# EasyEDA Pro project ProProject_2023新生开发板（小组）_2025-05-30.epro, schematic Schematic1_3
Create Date: 2024-03-11; Page Name: P1; Project Name: 2023新生开发板; Schematic Name: Schematic1_3; Update Date: 2024-03-11; Company: 学生电子爱好者协会; Drawed: ZhengLi; Page Size: A3; Reviewed: ZhengLi; Version: V2.2
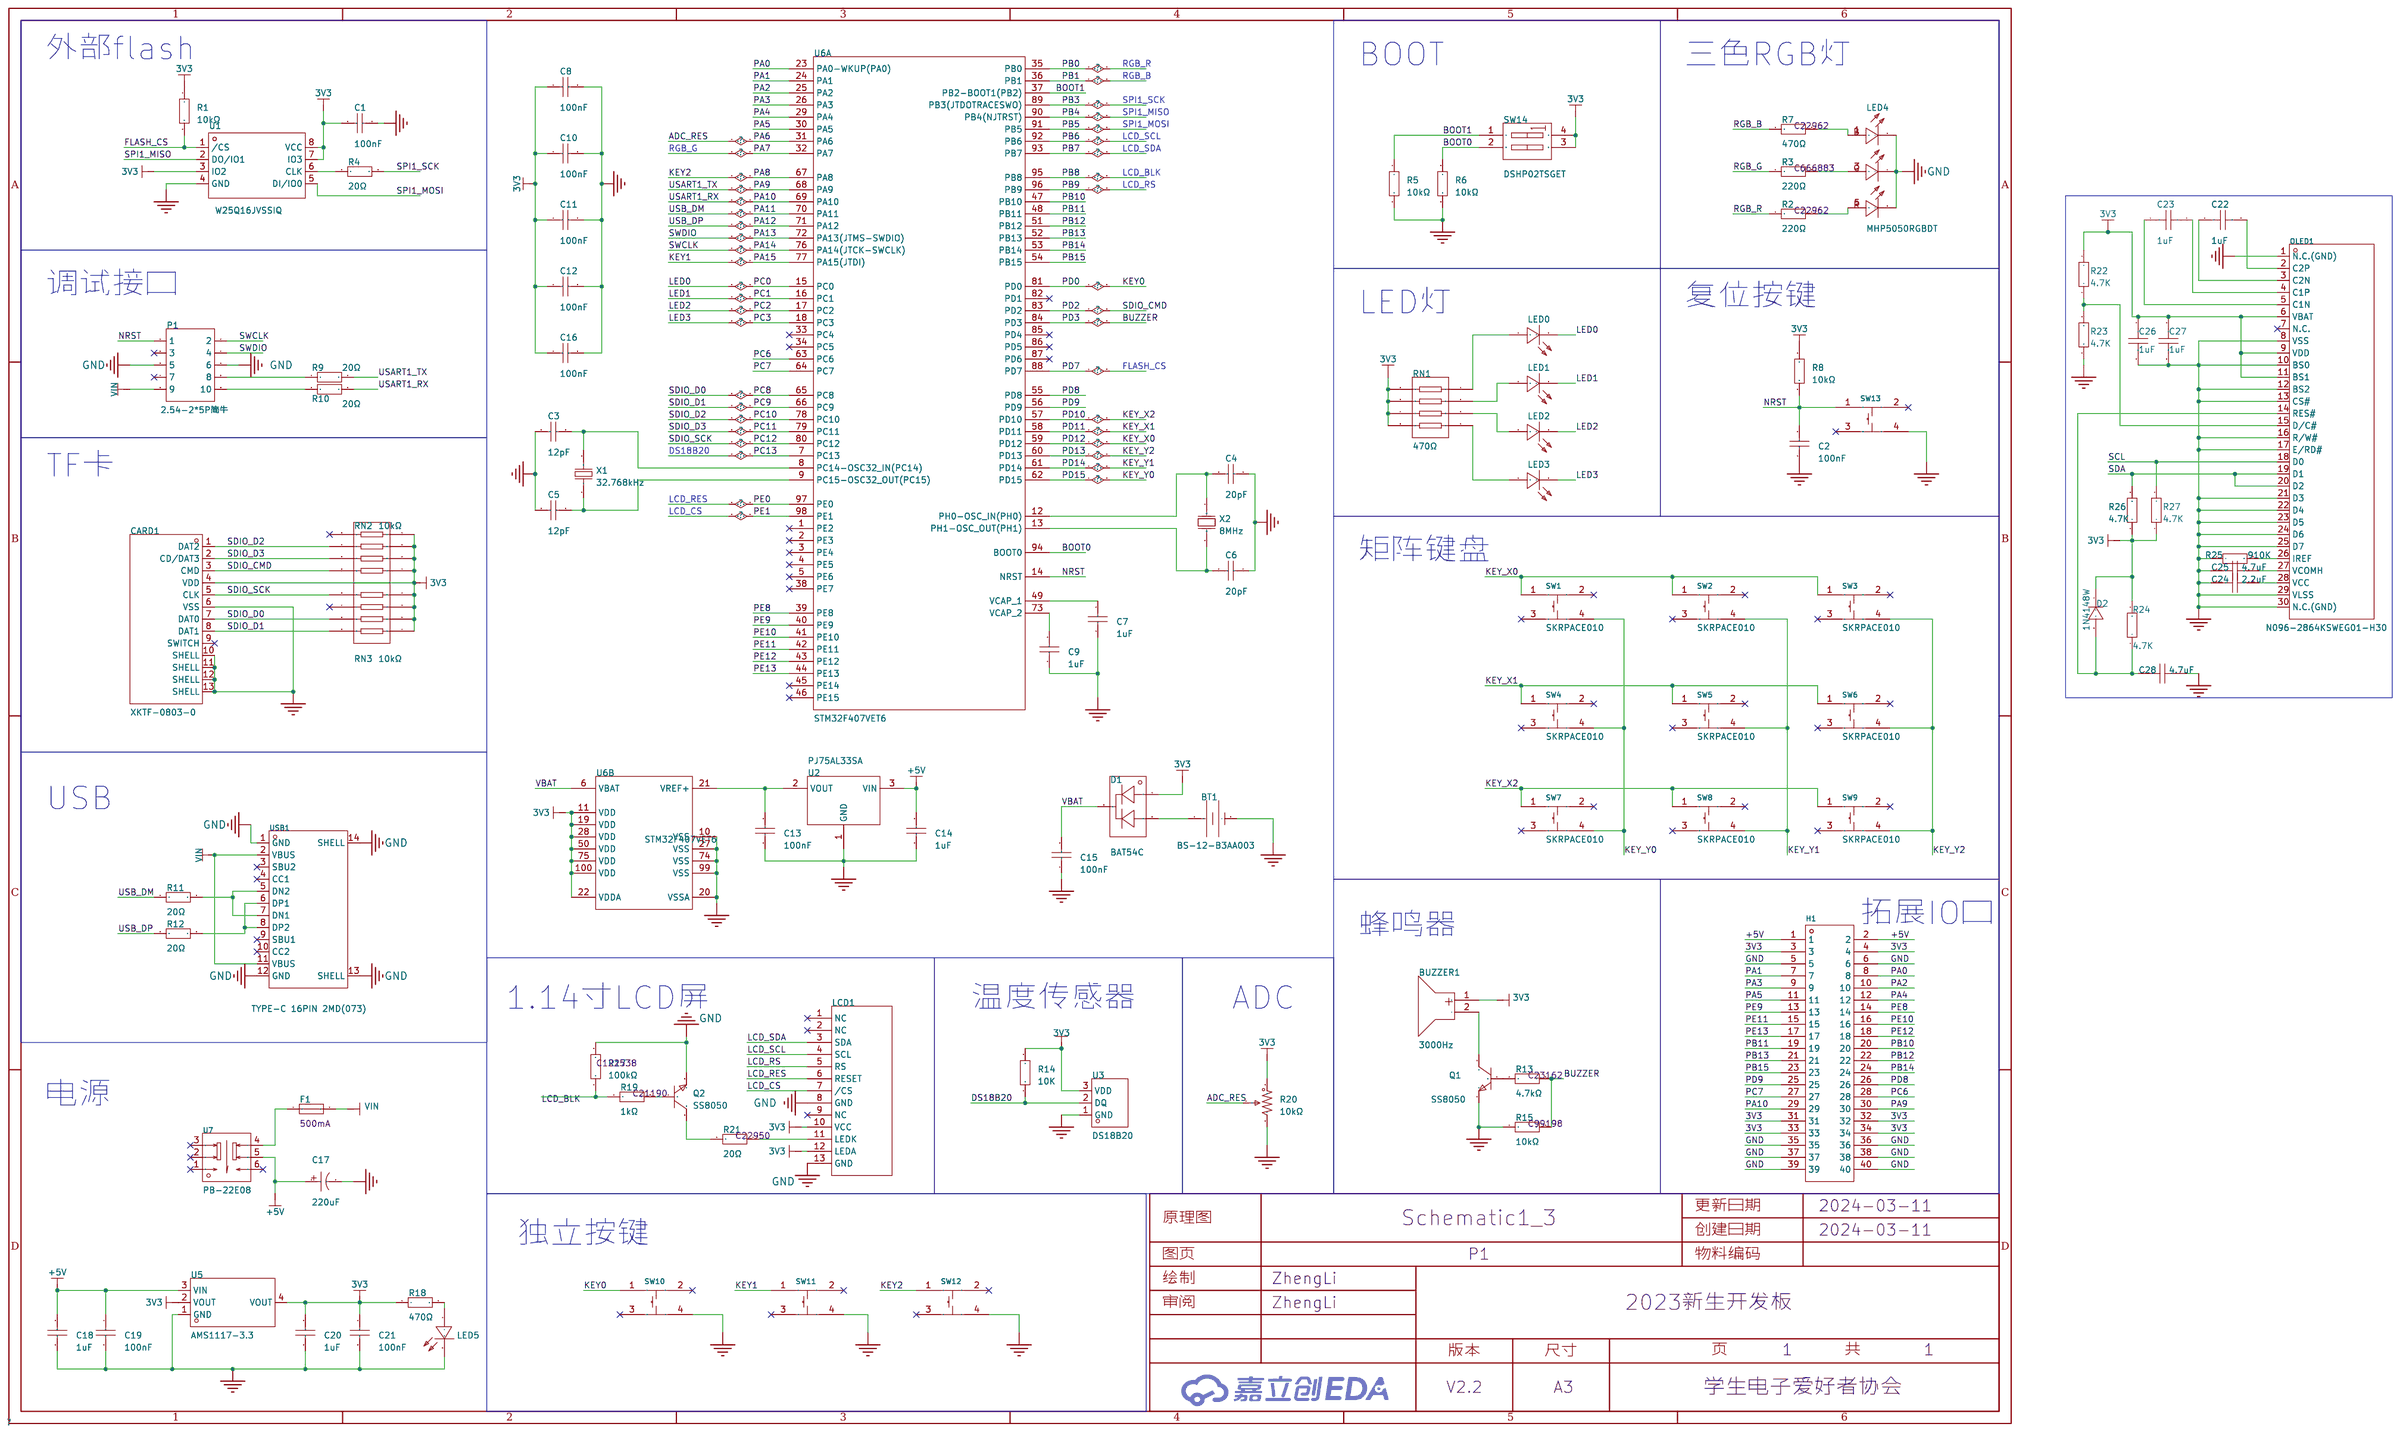
[diagram p1: schematic sheet]

## Parts
BT1  BS-12-B3AA003  [BAT-SMD_BS-12-B3AA011]
BUZZER1  3000Hz  [BUZ-TH_BD9.6-P5.00-D0.7-FD]
C1  100nF  [C0603]
C2  100nF  [C0603]
C3  12pF  [C0603]
C4  20pF  [C0603]
C5  12pF  [C0603]
C6  20pF  [C0603]
C7  1uF  [C0603]
C8  100nF  [C0603]
C9  1uF  [C0603]
C10  100nF  [C0603]
C11  100nF  [C0603]
C12  100nF  [C0603]
C13  100nF  [C0603]
C14  1uF  [C0603]
C15  100nF  [C0603]
C16  100nF  [C0603]
C17  220uF  [CAP-SMD_BD6.3-L6.6-W6.6-LS7.2-R-RD]
C18  1uF  [C0603]
C19  100nF  [C0603]
C20  1uF  [C0603]
C21  100nF  [C0603]
C22  1uF  [C0603]
C23  1uF  [C0603]
C24  2.2uF  [C0603]
C25  4.7uF  [C0603]
C26  1uF  [C0603]
C27  1uF  [C0603]
C28  4.7uF  [C0603]
CARD1  XKTF-0803-0  [TF-SMD_XKTF-0803-0]
D1  BAT54C  [SOT-23-3_L2.9-W1.4-P1.91-LS2.6-BR]
D2  1N4148W  [SOD-123_L2.8-W1.8-LS3.7-RD]
F1  BSMD0805-020-30V  [F0805]
H1  B-2100S40P-B110  [HDR-TH_40P-P2.54-V-M-R2-C20-S2.54]
LCD1  -  [1.14LCD]
LED0  NCD0603R3  [LED0603-R-RD_RED]
LED1  NCD0603R3  [LED0603-R-RD_RED]
LED2  NCD0603R3  [LED0603-R-RD_RED]
LED3  NCD0603R3  [LED0603-R-RD_RED]
LED4  MHP5050RGBDT  [LED-ARRAY-SMD_6P-L5.0-W5.0-TR-RD]
LED5  NCD0603R3  [LED0603-R-RD_RED]
OLED1  N096-2864KSWEG01-H30  [OLED_0.96-30P-P0.70-12864]
P1  2.54-2*5P简牛  [IDC-TH_10P-P2.54_C5665]
Q1  SS8050  [SOT-23-3_L2.9-W1.3-P1.90-LS2.4-BR]
Q2  SS8050  [SOT-23-3_L2.9-W1.3-P1.90-LS2.4-BR]
R1  10kΩ  [R0603]
R2  220Ω  [R0603]
R3  220Ω  [R0603]
R4  20Ω  [R0603]
R5  10kΩ  [R0603]
R6  10kΩ  [R0603]
R7  470Ω  [R0603]
R8  10kΩ  [R0603]
R9  20Ω  [R0603]
R10  20Ω  [R0603]
R11  20Ω  [R0603]
R12  20Ω  [R0603]
R13  4.7kΩ  [R0603]
R14  10K  [R0603]
R15  10kΩ  [R0603]
R17  100kΩ  [R0603]
R18  470Ω  [R0603]
R19  1kΩ  [R0603]
R20  10kΩ  [RES-ADJ-TH_3362P]
R21  20Ω  [R0603]
R22  4.7K  [R0603]
R23  4.7K  [R0603]
R24  4.7K  [R0603]
R25  910K  [R0603]
R26  4.7K  [R0603]
R27  4.7K  [R0603]
RN1  470Ω  [RES-ARRAY-SMD_0603-8P-L3.2-W1.6-BL]
RN2  10kΩ  [RES-ARRAY-SMD_0603-8P-L3.2-W1.6-BL]
RN3  10kΩ  [RES-ARRAY-SMD_0603-8P-L3.2-W1.6-BL]
SW1  SKRPACE010  [KEY-SMD_4P-L4.2-W3.2-P2.20-LS4.6]
SW2  SKRPACE010  [KEY-SMD_4P-L4.2-W3.2-P2.20-LS4.6]
SW3  SKRPACE010  [KEY-SMD_4P-L4.2-W3.2-P2.20-LS4.6]
SW4  SKRPACE010  [KEY-SMD_4P-L4.2-W3.2-P2.20-LS4.6]
SW5  SKRPACE010  [KEY-SMD_4P-L4.2-W3.2-P2.20-LS4.6]
SW6  SKRPACE010  [KEY-SMD_4P-L4.2-W3.2-P2.20-LS4.6]
SW7  SKRPACE010  [KEY-SMD_4P-L4.2-W3.2-P2.20-LS4.6]
SW8  SKRPACE010  [KEY-SMD_4P-L4.2-W3.2-P2.20-LS4.6]
SW9  SKRPACE010  [KEY-SMD_4P-L4.2-W3.2-P2.20-LS4.6]
SW10  SKRPACE010  [KEY-SMD_4P-L4.2-W3.2-P2.20-LS4.6]
SW11  SKRPACE010  [KEY-SMD_4P-L4.2-W3.2-P2.20-LS4.6]
SW12  SKRPACE010  [KEY-SMD_4P-L4.2-W3.2-P2.20-LS4.6]
SW13  SKRPACE010  [KEY-SMD_4P-L4.2-W3.2-P2.20-LS4.6]
SW14  DSHP02TSGET  [SW-SMD_4P_DSHP02TSGET]
U1  W25Q16JVSSIQ  [SOIC-8_L5.3-W5.3-P1.27-LS8.0-BL]
U2  PJ75AL33SA  [SOT-23_L2.9-W1.3-P1.90-LS2.4-BR]
U3  DS18B20  [TO-92-3_L4.9-W3.7-P1.27-L]
U5  AMS1117-3.3  [SOT-223-3_L6.5-W3.4-P2.30-LS7.0-BR]
U6  STM32F407VET6  [LQFP-100_L14.0-W14.0-P0.50-LS16.0-BL]  (sections 1,2)
U7  PB-22E08  [SW-TH_6P-L8.0-W8.0-P2.50_PB-22E08]
USB1  TYPE-C 16PIN 2MD(073)  [USB-C-SMD_TYPE-C-6PIN-2MD-073]
X1  32.768kHz  [FC-135R_L3.2-W1.5]
X2  8MHz  [CRYSTAL-SMD_L11.5-W4.8-LS12.7]

## Library data of the parts
BT1 = BS-12-B3AA003: 连接器类型:电池底座;适用电池规格:CR1220;工作温度范围:-25℃~+85℃;; LCSC Part Name: 电池底座 适用电池:CR1220; Supplier Part: C964723; Manufacturer: MYOUNG(美阳); Supplier Footprint: SMD; JLCPCB Part Class: 扩展库; Datasheet: https://atta.szlcsc.com/upload/public/pdf/source/20201218/C964723_733B638E287393F86295A2A4DAE43C75.pdf; Supplier: LCSC; Connector Type: 电池底座; Battery Type: CR1220; Operating Temperature Range: -25℃~+85℃
BUZZER1 = HNB09A05: 驱动方式:有源(内含驱动线路);构造类型:电磁式;额定电压:5V;工作电压:4V~8V;频率:3000Hz;声压(SPL):85dB@5V,10cm;直径(φD):9mm;高度:5.7mm;; Supplier Part: C96493; Manufacturer: 华能; Supplier Footprint: 插件; JLCPCB Part Class: Extended Part; Datasheet: https://atta.szlcsc.com/upload/public/pdf/source/20170522/1495448327549.pdf; Supplier: LCSC; Oscillator Circuit: 有源(内含驱动线路); Technology Type: 电磁式; Rated Voltage: 5V; Operating Voltage: 4V~8V; Sound Pressure Level (SPL): 85dB@5V,10cm; Diameter (φD): 9mm; Height: 5.7mm; Current Consumption: 30mA; Operating Temperature: -20℃~+70℃
C1 C2 C8 C10-C13 C15 C16 C19 C21 = 0603B104K500NT: 容值:100nF;精度:±10%;额定电压:50V;材质(温度系数):X7R;; LCSC Part Name: 100nF ±10% 50V; Supplier Part: C30926; Manufacturer: FH(风华); Supplier Footprint: 0603; JLCPCB Part Class: 扩展库; Datasheet: https://atta.szlcsc.com/upload/public/pdf/source/20170923/C30926_1506149436298988724.pdf; Supplier: LCSC; Tolerance: ±10%; Voltage Rated: 50V; Temperature Coefficient: X7R
C3 C5 = 0603CG120J500NT: 温度系数:C0G;容值:12pF;精度:±5%;额定电压:50V;; LCSC Part Name: 12pF(120) ±5% 50V; Supplier Part: C1642; Manufacturer: FH(风华); Supplier Footprint: 0603; JLCPCB Part Class: 扩展库; Datasheet: https://atta.szlcsc.com/upload/public/pdf/source/20170923/C1642_1506149303064988436.pdf; Supplier: LCSC; Temperature Coefficient: C0G; Tolerance: ±5%; Voltage Rated: 50V
C4 C6 = CL10C200JB8NNNC: 容值:20pF;精度:±5%;额定电压:50V;材质(温度系数):C0G;; LCSC Part Name: 20pF ±5% 50V; Supplier Part: C1648; Manufacturer: SAMSUNG(三星); Supplier Footprint: 0603; JLCPCB Part Class: Basic Part; Datasheet: https://atta.szlcsc.com/upload/public/pdf/source/20160103/1457707686863.pdf; Supplier: LCSC; Tolerance: ±5%; Voltage Rated: 50V; Temperature Coefficient: C0G
C7 C9 C14 C18 C20 = CL10A105KB8NNNC: 容值:1uF;精度:±10%;额定电压:50V;材质(温度系数):X5R;; LCSC Part Name: 1uF ±10% 50V; Supplier Part: C15849; Manufacturer: SAMSUNG(三星); Supplier Footprint: 0603; JLCPCB Part Class: 基础库; Datasheet: https://atta.szlcsc.com/upload/public/pdf/source/20160103/1457707679084.pdf; Supplier: LCSC; Tolerance: ±10%; Voltage Rated: 50V; Temperature Coefficient: X5R
C17 = RVT1A221M0605: 容值:220uF;精度:±20%;额定电压:10V;纹波电流:-;等效串联电阻:-;; LCSC Part Name: 220uF ±20% 10V; Supplier Part: C3345; Manufacturer: HONOR(荣誉); Supplier Footprint: SMD,D6.3xL5.4mm; JLCPCB Part Class: 扩展库; Datasheet: https://atta.szlcsc.com/upload/public/pdf/source/20220520/1BCC52842751E84E020A4D0B70BC5F88.pdf; Supplier: LCSC; Tolerance: ±20%; Rated Voltage: 10V; φD: 6.3mm; L: 5.4mm; Lifetime @ Temp: 2000hrs@105℃; Operating Temperature: -55℃~+105℃
C22-C28 = CAP_0603: Supplier Footprint: 0603
CARD1 = XKTF-0803-0: 卡连接方式:拔插式;卡类型:MicroSD卡(TF卡);连接器类型:卡座;本体最大高度:1.5mm;触头材质:铜合金;触头镀层:金;工作温度范围:-25℃~+80℃;焊接温度(最大值):260℃;; LCSC Part Name: 拔插式 MicroSD卡(TF卡) 卡座; Supplier Part: C381083; Manufacturer: XKB Connectivity(中国星坤); Supplier Footprint: SMD; JLCPCB Part Class: 扩展库; Datasheet: https://atta.szlcsc.com/upload/public/pdf/source/20211015/8C75DA687A058F602BACF8D5B7EF5CC3.pdf; Supplier: LCSC; Card Connection Mode: 拔插式; Card Type: MicroSD卡(TF卡); Connector Type: 卡座; Maximum Body Height: 1.5mm; Contact Material: 铜合金; Contact Plating: 金; Operating Temperature Range: -25℃~+80℃; Welding Temperature (Max): 260℃
D1 = BAT54C_C727125: 二极管配置:1对共阴极;直流反向耐压(Vr):30V;平均整流电流(Io):200mA;正向压降(Vf):1V@100mA;反向电流(Ir):2uA@25V;; LCSC Part Name: 30V 200mA 1V@100mA; Supplier Part: C727125; Manufacturer: TWGMC(台湾迪嘉); Supplier Footprint: SOT-23; JLCPCB Part Class: 扩展库; Datasheet: https://atta.szlcsc.com/upload/public/pdf/source/20200827/C727125_FA9D830E6485A4AEFAD08726CE8D43AC.pdf; Supplier: LCSC; Diode Configuration: 1对共阴极; Reverse Voltage (Vr): 30V; Average Rectified Current (Io): 200mA; Forward Voltage (Vf@If): 1V@100mA; Reverse Leakage Current (Ir): 2uA@25V
D2 = 1N4148W_C2099: 二极管配置:独立式;正向压降(Vf):1.25V@150mA;直流反向耐压(Vr):100V;平均整流电流(Io):150mA;功率:500mW;反向恢复时间(trr):4ns;; LCSC Part Name: 电压:100V 电流:150mA; Supplier Part: C2099; Manufacturer: CJ(江苏长电/长晶); Supplier Footprint: SOD-123; JLCPCB Part Class: 扩展库; Datasheet: https://atta.szlcsc.com/upload/public/pdf/source/20120428/1457706480199.pdf; Supplier: LCSC; Diode Configuration: 独立式; Forward Voltage (Vf@If): 1.25V@150mA; Reverse Voltage (Vr): 100V; Average Rectified Current (Io): 150mA; Power Dissipation: 500mW; Reverse Leakage Current: 1uA@75V; Reverse Recovery Time (trr): 4ns
F1 = BSMD0805-020-30V: 最大电压:30V;最大电流:40A;保持电流:200mA;跳闸电流:500mA;; LCSC Part Name: 30V 200mA 0805自恢复; Supplier Part: C883105; Manufacturer: BHFUSE(佰宏); Supplier Footprint: 0805; JLCPCB Part Class: 扩展库; Datasheet: https://atta.szlcsc.com/upload/public/pdf/source/20220223/3FD8E8A8A3681642EAEF465E16495357.pdf; Supplier: LCSC; Operating Voltage (Max): 30V; Current Rating (Max): 40A; Hold Current: 200mA; Trip Current: 500mA; Power Dissipation: 500mW; Resistance - Initial (Ri) (Min): 500mΩ; Resistance - Post Trip (R1) (Max): 3.5Ω; Maximum Time to Trip: 20ms; Operating Temperature: -40℃~+85℃
H1 = B-2100S40P-B110: 排数:双排;总PIN位数:40;间距:2.54mm;插针结构:2x20P;行距:2.54mm;安装类型:直插;圆针/方针:-;额定电流:-;额定电压:-;配合针长度:6mm;塑高:2.54mm;端接针长度:3mm;触头材质:黄铜;触头镀层:-;工作温度范围:-40℃~+105℃;颜色:黑色;; LCSC Part Name: 2.54mm 2x20P 直插; Supplier Part: C124383; Manufacturer: Ckmtw(灿科盟); Supplier Footprint: 直插,P=2.54mm; JLCPCB Part Class: 扩展库; Supplier: LCSC; Number of Rows: 双排; Number of Pins: 40; Pitch: 2.54mm; Pin Structure: 2x20P; Row Spacing: 2.54mm; Mounting Type: 直插; Length of Mating Pin: 6mm; Insulation Height: 2.54mm; Length of End Connection Pin: 3mm; Contact Material: 黄铜; Operating Temperature Range: -40℃~+105℃; Color: 黑色
LCD1 = 1.14LCD
LED0-LED3 LED5 = NCD0603R3: 尺寸1.6x0.8x0.8；IF=20ma：1.6~2.6v，620~640nm,51~150mcd金线，光强高，功耗低，可靠性好，寿命长; LCSC Part Name: 红色;贴片LED;0603红灯;; Supplier Part: C3151730; Manufacturer: 国星光电; Supplier Footprint: 0603; JLCPCB Part Class: 扩展库; Datasheet: https://atta.szlcsc.com/upload/public/pdf/source/20220704/CBFF28C1847A97213A75929E60B7DDE7.pdf; Supplier: LCSC; Emitted Color: 红灯; Operating Temperature: -40℃~+85℃
LED4 = MHP5050RGBDT: 发光颜色:RGB三色;二极管配置:-;主波长:617nm~627nm；465nm~475nm；515nm~525nm;色温:-;功率:95mW；95mW；120mW;安装方式:-;; LCSC Part Name: RGB三色; Supplier Part: C409780; Manufacturer: MEIHUA(美华); Supplier Footprint: SMD5050; JLCPCB Part Class: 扩展库; Datasheet: https://atta.szlcsc.com/upload/public/pdf/source/20190807/C409780_7CBB1A902F05A84E1F25EF1F7B89EEEB.pdf; Supplier: LCSC; Emitted Color: RGB三色; Lens Color: 雾状白; Dominant Wavelength: 617nm~627nm；465nm~475nm；515nm~525nm; Peak Wavelength: 518nm；632nm；468nm; Forward Current: 20mA; Power Dissipation: 95mW；95mW；120mW; Operating Temperature: -40℃~+85℃
OLED1 = N096-2864KSWEG01-H30: 主控芯片:SSD1306;尺寸(inch):0.96;; LCSC Part Name: 0.96寸 白色 128x64像素分辨率 单色 30PIN; Supplier Part: C2890596; Manufacturer: Newvision(新智景); JLCPCB Part Class: 扩展库; Supplier: LCSC; Main Control Chip: SSD1306; Size: 0.96
P1 = 2.54-2*5P简牛: 连接器类型:简牛座;每排PIN数:5;排数:2;间距:2.54mm;行距:2.54mm;封装形式:直插;触头材质:-;触头镀层:-;; LCSC Part Name: 每排P数:5 排数:2 2.54mm; Supplier Part: C5665; Manufacturer: BOOMELE(博穆精密); Supplier Footprint: 插件,P=2.54mm; JLCPCB Part Class: 扩展库; Datasheet: https://atta.szlcsc.com/upload/public/pdf/source/20140331/1457707037896.pdf; Supplier: LCSC; Connector Type: 简牛座; Pin Number in each Row: 5; Number of Rows: 2; Pitch: 2.54mm; Row Spacing: 2.54mm; Holder Type: 直插
Q1 Q2 = SS8050_C2150: 晶体管类型:NPN;集射极击穿电压(Vceo):25V;集电极电流(Ic):1.5A;功率(Pd):300mW;直流电流增益(hFE@Ic,Vce):200@100mA,1V;; LCSC Part Name: NPN 25V 1.5A Y1 200-350; Supplier Part: C2150; Manufacturer: CJ(江苏长电/长晶); Supplier Footprint: SOT-23; JLCPCB Part Class: Basic Part; Datasheet: https://atta.szlcsc.com/upload/public/pdf/source/20230322/AEE86F4B043774EFF80CAEA14A37D9E9.pdf; Supplier: LCSC; Transistor Type: NPN; Collector-Emitter Breakdown Voltage (Vceo): 25V; Collector Current (Ic): 1.5A; Power Dissipation (Pd): 300mW; Collector Cut-Off Current (Icbo): 100nA; Collector-Emitter Saturation Voltage (VCE(sat)@Ic,Ib): 500mV@800mA,80mA; DC Current Gain (hFE@Ic,Vce): 200@100mA,1V; Transition Frequency (fT): 100MHz; Operating Temperature: +150℃@(Tj)
R1 R5 R6 R8 = RC0603JR-0710KL: 电阻类型:厚膜电阻;阻值:10kΩ;精度:±5%;功率:100mW;; LCSC Part Name: 10kΩ ±5% 100mW; Supplier Part: C99198; Manufacturer: YAGEO(国巨); Supplier Footprint: 0603; JLCPCB Part Class: 扩展库; Datasheet: https://atta.szlcsc.com/upload/public/pdf/source/20181223/C99198_917934A193F41F77D9F7D214A8C79116.pdf; Supplier: LCSC; Type: 厚膜电阻; Tolerance: ±5%; Power(Watts): 100mW; Temperature Coefficient: ±100ppm/℃; Overload Voltage (Max): 75V; Operating Temperature Range: -55℃~+155℃
R2 R7 = 0603WAF2200T5E: 电阻类型:厚膜电阻;阻值:220Ω;精度:±1%;功率:100mW;; LCSC Part Name: 220Ω ±1% 100mW; Supplier Part: C22962; Manufacturer: UNI-ROYAL(厚声); Supplier Footprint: 0603; JLCPCB Part Class: Basic Part; Datasheet: https://atta.szlcsc.com/upload/public/pdf/source/20200306/C422600_1E6D84923E4A46A82E41ADD87F860B5C.pdf; Supplier: LCSC; Type: 厚膜电阻; Tolerance: ±1%; Power(Watts): 100mW; Temperature Coefficient: ±100ppm/℃; Overload Voltage (Max): 75V; Operating Temperature Range: -55℃~+155℃
R3 = TD03G4700BT: 阻值:470Ω;精度:±0.1%;功率:100mW;; LCSC Part Name: 470Ω ±0.1% 100mW; Supplier Part: C666883; Manufacturer: FH(风华); Supplier Footprint: 0603; JLCPCB Part Class: Extended Part; Datasheet: https://atta.szlcsc.com/upload/public/pdf/source/20200616/C657321_2CFA27FA726BC0D0F6223AF922169515.pdf; Supplier: LCSC; Tolerance: ±0.1%; Power(Watts): 100mW; Temperature Coefficient: ±25ppm/℃; Overload Voltage (Max): 50V; Operating Temperature Range: -55℃~+155℃; Type: 厚膜电阻
R4 R9-R12 R14 R21 = 0603WAF200JT5E: 电阻类型:厚膜电阻;阻值:20Ω;精度:±1%;功率:100mW;; LCSC Part Name: 20Ω ±1% 100mW; Supplier Part: C22950; Manufacturer: UNI-ROYAL(厚声); Supplier Footprint: 0603; JLCPCB Part Class: Basic Part; Datasheet: https://atta.szlcsc.com/upload/public/pdf/source/20200306/C422600_1E6D84923E4A46A82E41ADD87F860B5C.pdf; Supplier: LCSC; Type: 厚膜电阻; Tolerance: ±1%; Power(Watts): 100mW; Temperature Coefficient: ±100ppm/℃; Overload Voltage (Max): 75V; Operating Temperature Range: -55℃~+155℃
R13 = 0603WAF4701T5E: 电阻类型:厚膜电阻;阻值:4.7kΩ;精度:±1%;功率:100mW;; LCSC Part Name: 4.7kΩ ±1% 100mW; Supplier Part: C23162; Manufacturer: UNI-ROYAL(厚声); Supplier Footprint: 0603; JLCPCB Part Class: Basic Part; Datasheet: https://atta.szlcsc.com/upload/public/pdf/source/20200306/C422600_1E6D84923E4A46A82E41ADD87F860B5C.pdf; Supplier: LCSC; Type: 厚膜电阻; Tolerance: ±1%; Power(Watts): 100mW; Temperature Coefficient: ±100ppm/℃; Overload Voltage (Max): 75V; Operating Temperature Range: -55℃~+155℃
R15 = RC0603JR-0710KL: 电阻类型:厚膜电阻;阻值:10kΩ;精度:±5%;功率:100mW;; LCSC Part Name: 10kΩ ±5% 100mW; Supplier Part: C99198; Manufacturer: YAGEO(国巨); Supplier Footprint: 0603; JLCPCB Part Class: Extended Part; Datasheet: https://atta.szlcsc.com/upload/public/pdf/source/20181223/C99198_917934A193F41F77D9F7D214A8C79116.pdf; Supplier: LCSC; Type: 厚膜电阻; Tolerance: ±5%; Power(Watts): 100mW; Temperature Coefficient: ±100ppm/℃; Overload Voltage (Max): 75V; Operating Temperature Range: -55℃~+155℃
R17 = RT0603BRD07100KL: 电阻类型:薄膜电阻;阻值:100kΩ;精度:±0.1%;功率:100mW;; LCSC Part Name: 100kΩ ±0.1% 100mW; Supplier Part: C122538; Manufacturer: YAGEO(国巨); Supplier Footprint: 0603; JLCPCB Part Class: Extended Part; Datasheet: https://atta.szlcsc.com/upload/public/pdf/source/20170721/C122538_1500619326323834092.pdf; Supplier: LCSC; Type: 薄膜电阻; Tolerance: ±0.1%; Power(Watts): 100mW; Temperature Coefficient: ±25ppm/℃; Overload Voltage (Max): 75V; Operating Temperature Range: -55℃~+155℃
R18 = 0603WAF4700T5E: 电阻类型:厚膜电阻;阻值:470Ω;精度:±1%;功率:100mW;; LCSC Part Name: 470Ω ±1% 100mW; Supplier Part: C23179; Manufacturer: UNI-ROYAL(厚声); Supplier Footprint: 0603; JLCPCB Part Class: Basic Part; Datasheet: https://atta.szlcsc.com/upload/public/pdf/source/20200306/C422600_1E6D84923E4A46A82E41ADD87F860B5C.pdf; Supplier: LCSC; Type: 厚膜电阻; Tolerance: ±1%; Power(Watts): 100mW; Temperature Coefficient: ±100ppm/℃; Overload Voltage (Max): 75V; Operating Temperature Range: -55℃~+155℃
R19 = 0603WAF1001T5E: 电阻类型:厚膜电阻;阻值:1kΩ;精度:±1%;功率:100mW;; LCSC Part Name: 1kΩ ±1% 100mW; Supplier Part: C21190; Manufacturer: UNI-ROYAL(厚声); Supplier Footprint: 0603; JLCPCB Part Class: Basic Part; Datasheet: https://atta.szlcsc.com/upload/public/pdf/source/20200306/C422600_1E6D84923E4A46A82E41ADD87F860B5C.pdf; Supplier: LCSC; Type: 厚膜电阻; Tolerance: ±1%; Power(Watts): 100mW; Temperature Coefficient: ±100ppm/℃; Overload Voltage (Max): 75V; Operating Temperature Range: -55℃~+155℃
R20 = 3362P-1-103: 阻值:10kΩ;精度:±10%;; LCSC Part Name: 10kΩ ±10%; Supplier Part: C118956; Manufacturer: BOCHEN(博晨); Supplier Footprint: 插件; JLCPCB Part Class: Extended Part; Datasheet: https://atta.szlcsc.com/upload/public/pdf/source/20171114/C118956_15106326650691117445.pdf; Supplier: LCSC; Tolerance: ±10%
R22-R27 = Res_0603: Supplier Footprint: 0603
RN1 = 4D03WGJ0471T5E: 阻值:470Ω;精度:±5%;单个元件功率:62.5mW;电阻器数:4;; LCSC Part Name: 470Ω ±5%; Supplier Part: C25510; Manufacturer: UNI-ROYAL(厚声); Supplier Footprint: 0603x4; JLCPCB Part Class: Basic Part; Datasheet: https://atta.szlcsc.com/upload/public/pdf/source/20170615/1497510995283.pdf; Supplier: LCSC; Tolerance: ±5%; Power(Watts): 62.5mW; Number of Resistors: 4; Number of Pins: 8; Temperature Coefficient: ±200ppm/℃
RN2 RN3 = 4D03WGJ0103T5E: 阻值:10kΩ;精度:±5%;单个元件功率:62.5mW;电阻器数:4;; LCSC Part Name: 10kΩ ±5%; Supplier Part: C29718; Manufacturer: UNI-ROYAL(厚声); Supplier Footprint: 0603x4; JLCPCB Part Class: Basic Part; Datasheet: https://atta.szlcsc.com/upload/public/pdf/source/20170615/1497511005633.pdf; Supplier: LCSC; Tolerance: ±5%; Power(Watts): 62.5mW; Number of Resistors: 4; Number of Pins: 8; Temperature Coefficient: ±200ppm/℃
SW1-SW13 = SKRPACE010: 触点电流:50mA;额定电压(DC):16V;电路结构:单刀单掷;安装方式:立贴;带灯:-;机械寿命:-;; LCSC Part Name: 4.2*3.2*2.5mm 立贴 轻触开关; Supplier Part: C139797; Manufacturer: ALPSALPINE(阿尔卑斯阿尔派); Supplier Footprint: SMD; JLCPCB Part Class: 扩展库; Datasheet: https://atta.szlcsc.com/upload/public/pdf/source/20171113/C139797_15105612676371115729.pdf; Supplier: LCSC; Contact Current: 50mA; Voltage Rating (DC): 16V; Circuit: 单刀单掷; Mounting Style: 立贴; Actuator Style: 椭圆形按钮; Switch Length: 4.2mm; Switch Width: 3.2mm; Switch Height: 2.5mm
SW14 = DSHP02TSGET: 类型:平拨，凹槽式;电路结构:单刀单掷;开关位数:2;引脚间距:1.27mm;颜色:黑色;; LCSC Part Name: 2位 1.27间距; Supplier Part: C40735; Manufacturer: YE; Supplier Footprint: SMD-4P,4.1x5.4mm; JLCPCB Part Class: 扩展库; Datasheet: https://atta.szlcsc.com/upload/public/pdf/source/20150928/1457707425261.pdf; Supplier: LCSC; Type: 平拨，凹槽式; Circuit: 单刀单掷; Number of Positions: 2; Lead Pitch: 1.27mm; Color: 黑色
U1 = W25Q16JVSSIQ: （与C131025为同一颗物料，只是包装方式不一样。）3V 16Mbit Serial Flash Memory with dual/quad SPI; Supplier Part: C82317; Manufacturer: WINBOND(华邦); Supplier Footprint: SOIC-8-208mil; JLCPCB Part Class: 扩展库; Datasheet: https://atta.szlcsc.com/upload/public/pdf/source/20210318/C131025_490139441AABAB3970D06D5A0D9163A5.pdf; Supplier: LCSC
U2 = PJ75AL33SA: Supplier Part: C411736; Manufacturer: PJSEMI(平晶微); Supplier Footprint: SOT-23; JLCPCB Part Class: 扩展库; Datasheet: https://atta.szlcsc.com/upload/public/pdf/source/20190819/C411736_AA59BFC75038658DA9B87B4772B68F3A.pdf; Supplier: LCSC
U3 = DS18B20: 温度范围:-55℃~125℃;供电电压:3V~5.5V;待机电流:-;接口类型:-;; Supplier Part: C376006; Manufacturer: UMW(广东友台半导体); Supplier Footprint: TO-92-3; JLCPCB Part Class: 扩展库; Datasheet: https://atta.szlcsc.com/upload/public/pdf/source/20220307/F147739DAED5754340FA7BABB64A1D8C.pdf; Supplier: LCSC; Temperature range: -55℃~125℃; Supply Voltage: 3V~5.5V
U5 = AMS1117-3.3_C6186: 输出类型:固定;输出极性:正;最大输入电压:-;输出电压:3.3V;输出电流:1A;电源纹波抑制比(PSRR):72dB@(120Hz);; LCSC Part Name: 输出3.3V 1A; Supplier Part: C6186; Manufacturer: AMS; Supplier Footprint: SOT-223; JLCPCB Part Class: 基础库; Datasheet: https://atta.szlcsc.com/upload/public/pdf/source/20180727/C6186_7A095716F0823C02F1997A905E26C086.pdf; Supplier: LCSC; Output Type: 固定; Output Polarity: 正; Number of Outputs: 1; Output Voltage: 3.3V; Dropout Voltage: 1.3V@(800mA); Output Current: 1A; Power Supply Rejection Ratio (PSRR): 72dB@(120Hz)
U6 = STM32F407VET6: CPU内核:ARM Cortex-M4;CPU最大主频:168MHz;工作电压范围:1.8V~3.6V;内部振荡器:有;程序 FLASH容量:512K@x8bit;RAM总容量:192KB;EEPROM/数据 FLASH容量:-;GPIO端口数量:82;ADC(单元数/通道数/位数):1@x16ch/12bit;DAC(单元数/通道数/位数):1@x2ch/12bit;外设/功能/协议栈:欠压检测/复位；DMA；LCD驱动；看门狗；POR；PWM;工作温度范围:-40℃~+85℃;; LCSC Part Name: ARM Cortex-M4 168MHz 闪存：512K@x8bit RAM：192KB; Supplier Part: C28730; Manufacturer: ST(意法半导体); Supplier Footprint: LQFP-100(14x14); JLCPCB Part Class: Extended Part; Datasheet: https://atta.szlcsc.com/upload/public/pdf/source/20140322/1457707027869.pdf; Supplier: LCSC; CPU Core: ARM Cortex-M4; Maximum Frequency: 168MHz; Supply Voltage Range: 1.8V~3.6V; Internal Oscillator: 有; Program FLASH Size: 512K@x8bit; RAM Size: 192KB; GPIO Ports Number: 82; ADC (Units/Channels/bits): 1@x16ch/12bit; DAC (Units/Channels/bits): 1@x2ch/12bit; Peripherals / Functions / Protocol Stacks: 欠压检测/复位；DMA；LCD驱动；看门狗；POR；PWM; Operating Temperature Range: -40℃~+85℃
U7 = PB-22E08: LCSC Part Name: 自锁按键开关; Supplier Part: C2848958; Manufacturer: G-Switch(品赞); Supplier Footprint: 8x8mm; Datasheet: https://atta.szlcsc.com/upload/public/pdf/source/20230616/E4440AC7CE198A071B7CAB3CD31ABBEA.pdf; Supplier: LCSC
USB1 = TYPE-C 16PIN 2MD(073): 连接器类型:Type-C;标准:-;公母:母座;触点数量:16;端口数量:1;安装方式:卧贴;额定电流 - 电源:5A;工作温度范围:-25℃~+85℃;; LCSC Part Name: TYPE-C母座 16P 4脚插件带定位柱 不锈钢外壳 2次模顶; Supplier Part: C2765186; Manufacturer: SHOU HAN(首韩); Supplier Footprint: SMD; JLCPCB Part Class: 扩展库; Supplier: LCSC; Connector Type: Type-C; Gender: 母座; Number of Contacts: 16; Number of Ports: 1; Mounting Style: 卧贴; Current Rating - Power (Max): 5A; Operating Temperature Range: -25℃~+85℃
X1 = Q13FC1350000400: 频率:32.768kHz;频率公差:±20ppm;负载电容:12.5pF;; LCSC Part Name: 32.768kHz ±20ppm 12.5pF; Supplier Part: C32346; Manufacturer: EPSON(爱普生); Supplier Footprint: SMD3215-2P; JLCPCB Part Class: 基础库; Datasheet: https://atta.szlcsc.com/upload/public/pdf/source/20190108/C32346_746D6B07EAF90824457A96480007685F.pdf; Supplier: LCSC; Crystal Type: 贴片无源晶振; Frequency Tolerance: ±20ppm; Load Capacitance: 12.5pF; Equivalent Series Resistance (ESR): 70kΩ; Operating Temperature: -40℃~+85℃
X2 = X49SM8MSD2SC: 频率:8MHz;频率公差:±20ppm;负载电容:20pF;; LCSC Part Name: 8MHz ±20ppm 20pF HC-49SMD; Supplier Part: C12674; Manufacturer: YXC(扬兴晶振); Supplier Footprint: HC-49S-SMD; JLCPCB Part Class: Basic Part; Datasheet: https://atta.szlcsc.com/upload/public/pdf/source/20210329/C106809_0E91E60850A780B284B63D653DC40EA4.pdf; Supplier: LCSC; Crystal Type: 49SMD; Frequency Tolerance: ±20ppm; Frequency Stability: ±30ppm; Load Capacitance: 20pF; Operating Temperature: -20℃~+70℃

## Nets
3V3: BUZZER1.1(+) C1.1 C8.1 C10.1 C11.1 C12.1 C16.1 C20.2 C21.1 C26.1 C27.1 CARD1.4(VDD) D1.1 D2.1(K) H1.3 H1.4 H1.31 H1.32 H1.33 H1.34 LCD1.10(VCC) LCD1.12(LEDA) OLED1.6(VBAT) OLED1.9(VDD) OLED1.11(BS1) R1.1 R8.1 R14.2 R18.1 R20.1 R22.2 R24.2 R26.1 R27.1 RN1.5 RN1.6 RN1.7 RN1.8 RN2.1 RN2.2 RN2.3 RN2.4 RN3.1 RN3.2 RN3.3 RN3.4 SW14.3(B2) SW14.4(B1) U1.3(IO2) U1.7(IO3) U1.8(VCC) U3.3(VDD) U5.2(VOUT) U5.4(VOUT) U6.11(VDD) U6.19(VDD) U6.22(VDDA) U6.28(VDD) U6.50(VDD) U6.75(VDD) U6.100(VDD)
+5V: C14.2 C17.1 C18.2 C19.1 H1.1 H1.2 U2.3(VIN) U5.3(VIN) U7.5
GND: BT1.2(-) C1.2 C2.1 C3.1 C4.2 C5.1 C6.2 C7.1 C8.2 C9.1 C10.2 C11.2 C12.2 C13.2 C14.1 C15.1 C16.2 C17.2 C18.1 C19.2 C20.1 C21.2 C24.1 C25.1 C26.2 C27.2 C28.2 CARD1.6(VSS) CARD1.10(SHELL) CARD1.11(SHELL) CARD1.12(SHELL) CARD1.13(SHELL) H1.5 H1.6 H1.35 H1.36 H1.37 H1.38 H1.39 H1.40 LCD1.8(GND) LCD1.13(GND) LED4.2(-) LED4.4(-) LED4.6(-) LED5.2(K) OLED1.1(N.C.(GND)) OLED1.8(VSS) OLED1.10(BS0) OLED1.12(BS2) OLED1.13(CS#) OLED1.16(R/W#) OLED1.17(E/RD#) OLED1.21(D3) OLED1.22(D4) OLED1.23(D5) OLED1.24(D6) OLED1.25(D7) OLED1.29(VLSS) OLED1.30(N.C.(GND)) P1.5 P1.6 Q1.2(E) Q2.2(E) R5.2 R6.2 R15.1 R17.2 R20.3 R23.1 R25.1 SW10.4 SW11.4 SW12.4 SW13.4 U1.4(GND) U2.1(GND) U3.1(GND) U5.1(GND) U6.10(VSS) U6.20(VSSA) U6.27(VSS) U6.74(VSS) U6.99(VSS) USB1.1(GND) USB1.12(GND) USB1.13(SHELL) USB1.14(SHELL)
VBAT: C15.2 D1.3 U6.6(VBAT)
VIN: F1.2 P1.9 USB1.2(VBUS) USB1.11(VBUS)
ADC_RES: R20.2 U6.31(PA6)
BOOT0: R6.1 SW14.2(A2) U6.94(BOOT0)
BOOT1: R5.1 SW14.1(A1) U6.37(PB2-BOOT1(PB2))
BUZZER: R13.2 R15.2 U6.84(PD3)
DS18B20: R14.1 U3.2(DQ) U6.7(PC13)
FLASH_CS: R1.2 U1.1(/CS) U6.88(PD7)
KEY0: SW10.1 U6.81(PD0)
KEY1: SW11.1 U6.77(PA15(JTDI))
KEY2: SW12.1 U6.67(PA8)
KEY_X0: SW1.1 SW2.1 SW3.1 U6.59(PD12)
KEY_X1: SW4.1 SW5.1 SW6.1 U6.58(PD11)
KEY_X2: SW7.1 SW8.1 SW9.1 U6.57(PD10)
KEY_Y0: SW1.4 SW4.4 SW7.4 U6.62(PD15)
KEY_Y1: SW2.4 SW5.4 SW8.4 U6.61(PD14)
KEY_Y2: SW3.4 SW6.4 SW9.4 U6.60(PD13)
LCD_BLK: R17.1 R19.1 U6.95(PB8)
LCD_CS: LCD1.7(/CS) U6.98(PE1)
LCD_RES: LCD1.6(RESET) U6.97(PE0)
LCD_RS: LCD1.5(RS) U6.96(PB9)
LCD_SCL: LCD1.4(SCL) U6.92(PB6)
LCD_SDA: LCD1.3(SDA) U6.93(PB7)
LED0: LED0.2(K) U6.15(PC0)
LED1: LED1.2(K) U6.16(PC1)
LED2: LED2.2(K) U6.17(PC2)
LED3: LED3.2(K) U6.18(PC3)
NRST: C2.2 P1.1 R8.2 SW13.1 U6.14(NRST)
PA0: H1.8 U6.23(PA0-WKUP(PA0))
PA1: H1.7 U6.24(PA1)
PA2: H1.10 U6.25(PA2)
PA3: H1.9 U6.26(PA3)
PA4: H1.12 U6.29(PA4)
PA5: H1.11 U6.30(PA5)
PA7: R3.1 U6.32(PA7)
PA9: H1.30 R9.2 U6.68(PA9)
PA10: H1.29 R10.1 U6.69(PA10)
PA11: R11.1 U6.70(PA11)
PA12: R12.1 U6.71(PA12)
PA13: P1.4 U6.72(PA13(JTMS-SWDIO))
PA14: P1.2 U6.76(PA14(JTCK-SWCLK))
PB0: R2.1 U6.35(PB0)
PB1: R7.1 U6.36(PB1)
PB3: R4.2 U6.89(PB3(JTDOTRACESWO))
PB4: U1.2(DO/IO1) U6.90(PB4(NJTRST))
PB5: U1.5(DI/IO0) U6.91(PB5)
PB10: H1.20 U6.47(PB10)
PB11: H1.19 U6.48(PB11)
PB12: H1.22 U6.51(PB12)
PB13: H1.21 U6.52(PB13)
PB14: H1.24 U6.53(PB14)
PB15: H1.23 U6.54(PB15)
PC6: H1.28 U6.63(PC6)
PC7: H1.27 U6.64(PC7)
PC8: CARD1.7(DAT0) RN3.6 U6.65(PC8)
PC9: CARD1.8(DAT1) RN3.5 U6.66(PC9)
PC10: CARD1.1(DAT2) RN2.7 U6.78(PC10)
PC11: CARD1.2(CD/DAT3) RN2.6 U6.79(PC11)
PC12: CARD1.5(CLK) RN3.8 U6.80(PC12)
PD2: CARD1.3(CMD) RN2.5 U6.83(PD2)
PD8: H1.26 U6.55(PD8)
PD9: H1.25 U6.56(PD9)
PE8: H1.14 U6.39(PE8)
PE9: H1.13 U6.40(PE9)
PE10: H1.16 U6.41(PE10)
PE11: H1.15 U6.42(PE11)
PE12: H1.18 U6.43(PE12)
PE13: H1.17 U6.44(PE13)
SCL: OLED1.18(D0) R27.2
SDA: OLED1.19(D1) OLED1.20(D2) R26.2
$1N17010: BT1.1(+) D1.2
$1N17307: C6.1 U6.13(PH1-OSC_OUT(PH1)) X2.2(OSC2)
$1N17325: C4.1 U6.12(PH0-OSC_IN(PH0)) X2.1(OSC1)
$1N17660: C5.2 U6.9(PC15-OSC32_OUT(PC15)) X1.1
$1N17667: C3.2 U6.8(PC14-OSC32_IN(PC14)) X1.2
$1N19212: R11.2 USB1.5(DN2) USB1.7(DN1)
$1N19218: R12.2 USB1.6(DP1) USB1.8(DP2)
$1N20370: R4.1 U1.6(CLK)
$1N22193: Q1.1(B) R13.1
$1N22195: BUZZER1.2(-) Q1.3(C)
$1N22473: LCD1.11(LEDK) R21.1
$1N22574: Q2.1(B) R19.2
$1N24327: P1.8 R9.1
$1N24330: P1.10 R10.2
$1N25907: C13.1 U2.2(VOUT) U6.21(VREF+)
$1N28242: C7.2 U6.49(VCAP_1)
$1N28245: C9.2 U6.73(VCAP_2)
$1N33732: Q2.3(C) R21.2
$1N33743: LED5.1(A) R18.2
$1N42121: LED4.3(+) R3.2
$1N45969: LED1.1(A) RN1.3
$1N45974: LED2.1(A) RN1.2
$1N45979: LED3.1(A) RN1.1
$1N45986: LED0.1(A) RN1.4
$1N54805: F1.1 U7.4
$1N62284: LED4.1(+) R7.2
$1N62288: LED4.5(+) R2.2
Net-(C22-1): C22.1 OLED1.3(C2N)
Net-(C22-2): C22.2 OLED1.2(C2P)
Net-(C23-1): C23.1 OLED1.5(C1N)
Net-(C23-2): C23.2 OLED1.4(C1P)
Net-(C24-2): C24.2 OLED1.28(VCC)
Net-(C25-2): C25.2 OLED1.27(VCOMH)
Net-(C28-1): C28.1 D2.2(A) OLED1.14(RES#) R24.1
Net-(OLED1-15): OLED1.15(D/C#) R22.1 R23.2
Net-(OLED1-26): OLED1.26(IREF) R25.2

Not connected (* = marked no-connect by the designer): CARD1 9(SWITCH)*; LCD1 1(NC)* 2(NC)* 9(NC)*; OLED1 7(N.C.)*; P1 3* 7*; RN2 8*; RN3 7*; SW1 2* 3*; SW2 2* 3*; SW3 2* 3*; SW4 2* 3*; SW5 2* 3*; SW6 2* 3*; SW7 2* 3*; SW8 2* 3*; SW9 2* 3*; SW10 2* 3*; SW11 2* 3*; SW12 2* 3*; SW13 2* 3*; U6 1(PE2)* 2(PE3)* 3(PE4)* 4(PE5)* 5(PE6)* 33(PC4)* 34(PC5)* 38(PE7)* 45(PE14)* 46(PE15)* 82(PD1)* 85(PD4)* 86(PD5)* 87(PD6)*; U7 1* 2* 3* 6*; USB1 3(SBU2)* 4(CC1)* 9(SBU1)* 10(CC2)*

## Notes on the sheet
- 外部flash
- BOOT
- 三色RGB灯
- 调试接口
- 复位按键
- LED灯
- TF卡
- 矩阵键盘
- USB
- 拓展IO口
- 蜂鸣器
- 1.14寸LCD屏
- 温度传感器
- ADC
- 电源
- 独立按键
